# Altium schematic sheet data_logger.SchDoc
size 420 x 297 mm; SheetNumber: 1; SheetTotal: 1; Обозначение_Код: ИУ4 11.03.03.26.06.63.15.003 Э3; п_Разраб_Р: Лучникова И.В.; п_Пров_Р: Чистяков М.Г.; Наименование1: Регистратор данных; Наименование2: на базе ATmega328P-PU; Вид_документа_SCH: Схема электрическая принципиальная
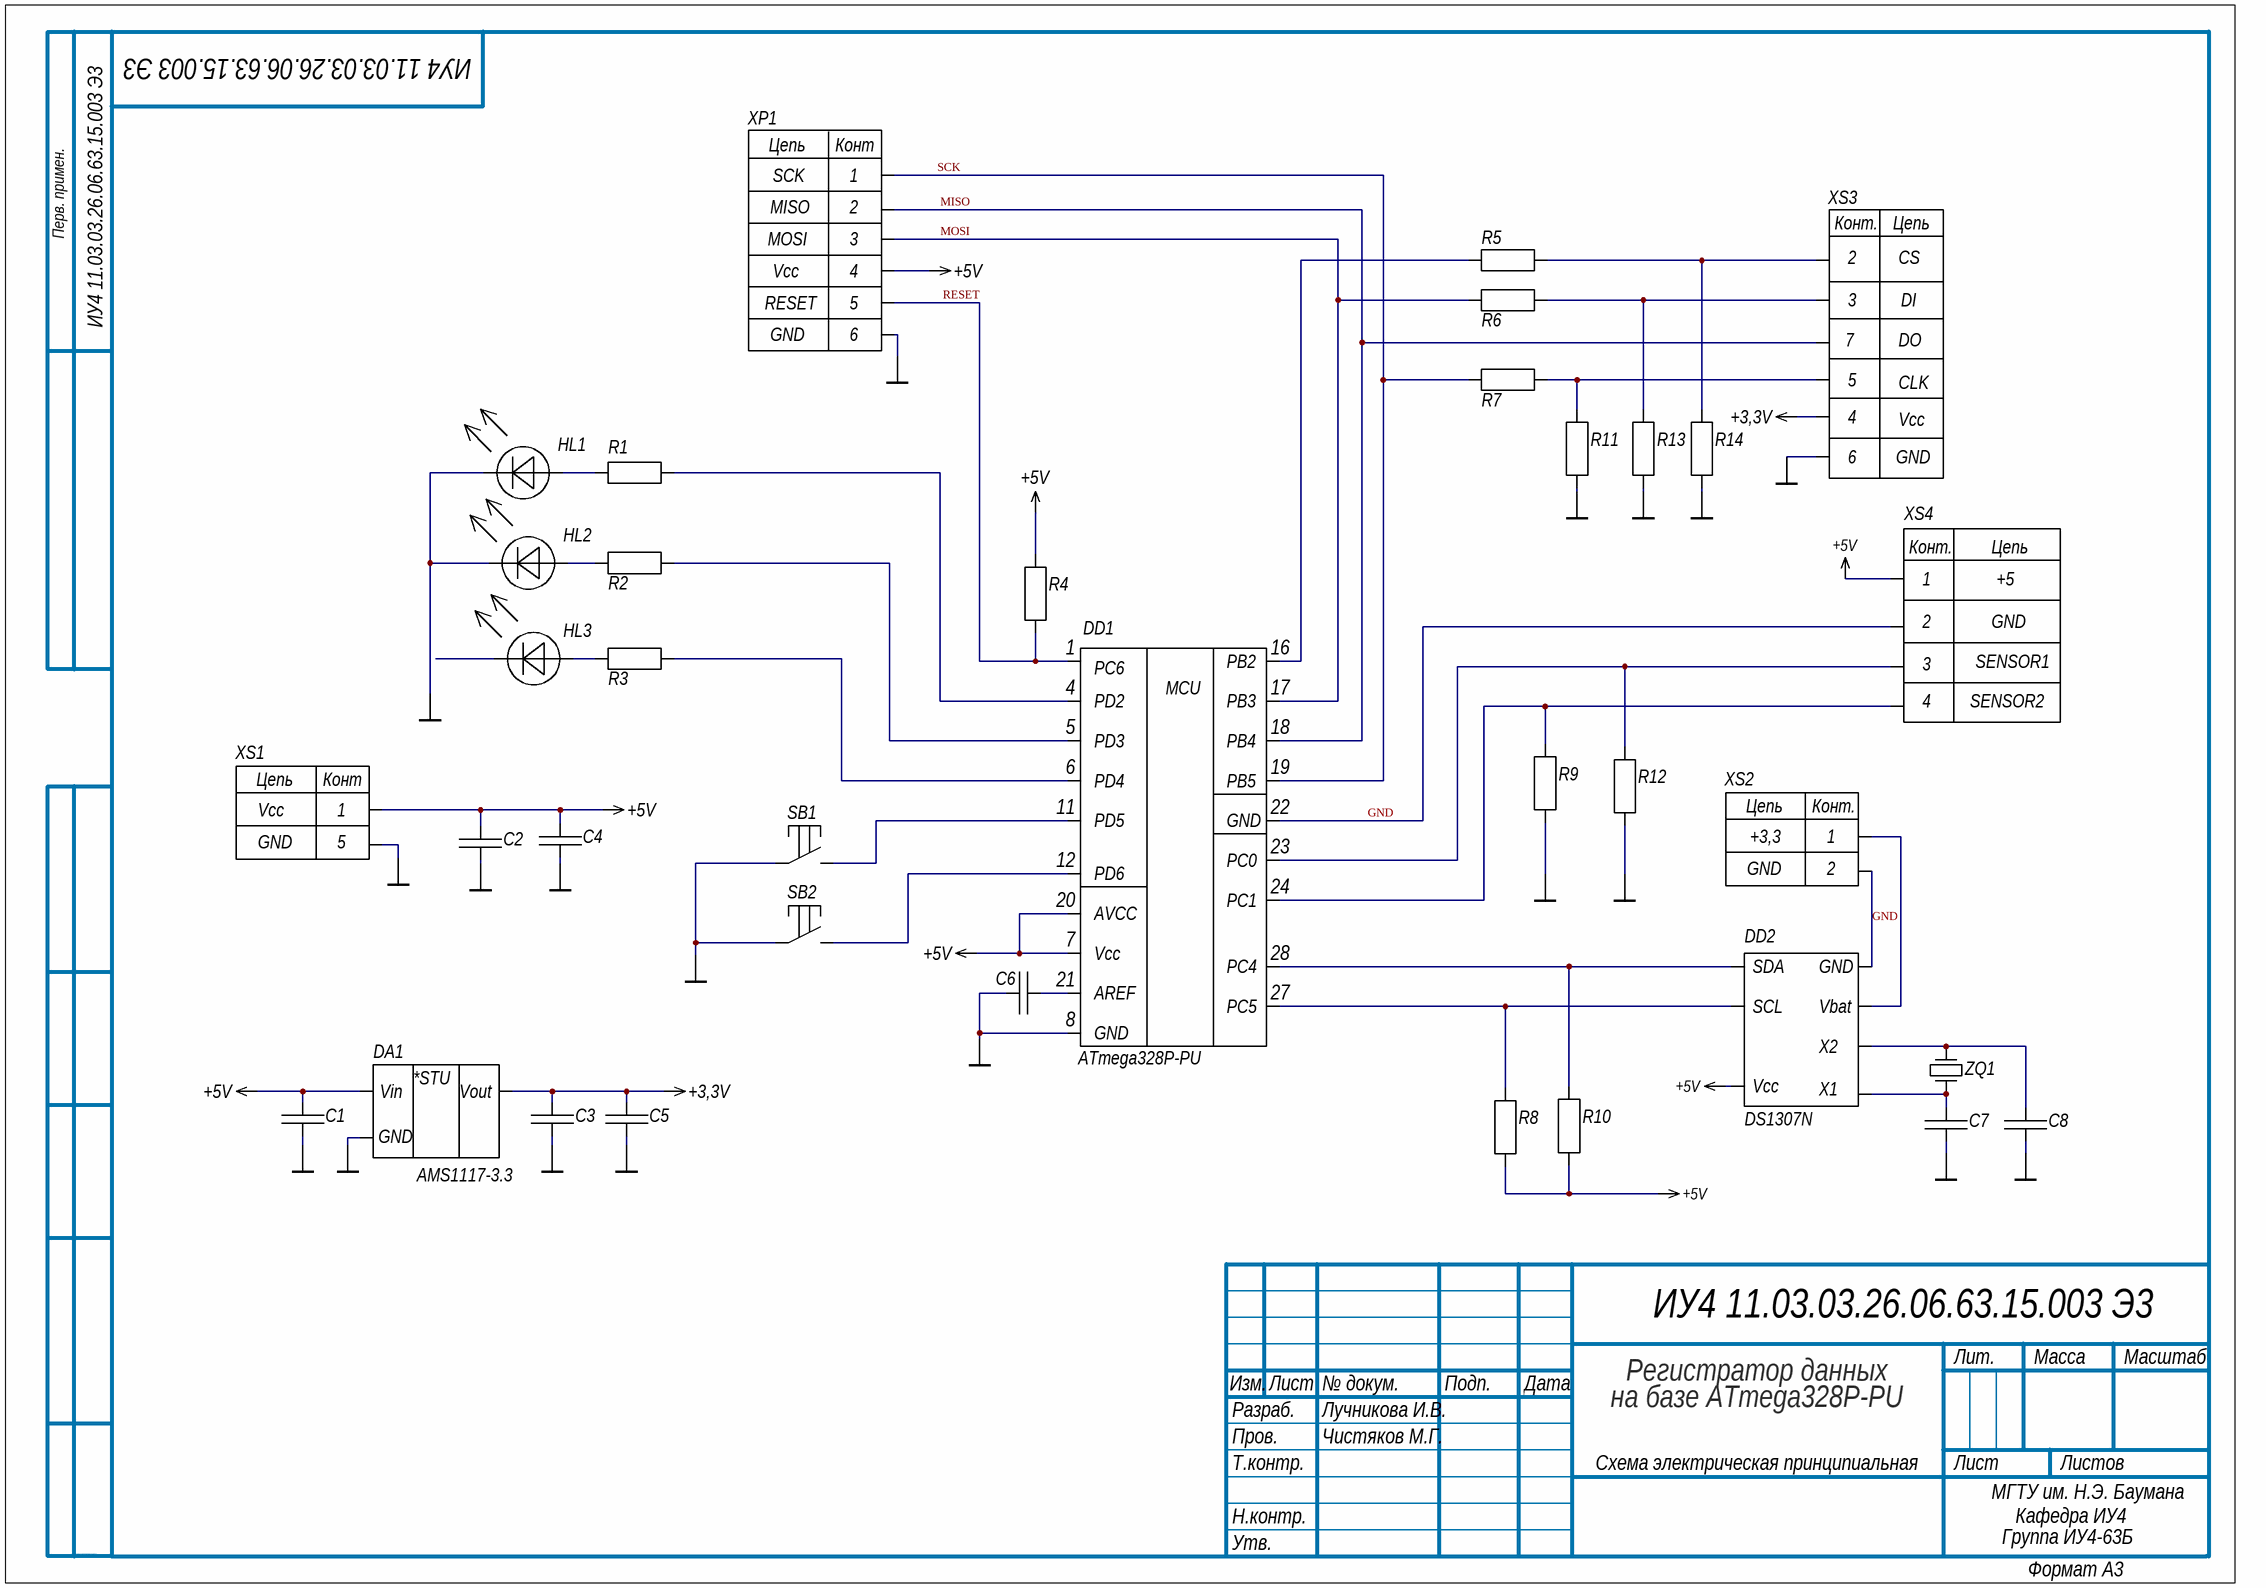
[diagram p0: data_logger.SchDoc]

## Parts
C1  cap  [SMDcap]  (value not drawn)
C2  cap  [SMDcap]  (value not drawn)
C3  cap  [SMDcap]  (value not drawn)
C4  cap  [SMDcap]  (value not drawn)
C5  cap  [SMDcap]  (value not drawn)
C6  cap  [SMDcap]  (value not drawn)
C7  cap  [SMDcap]  (value not drawn)
C8  cap  [SMDcap]  (value not drawn)
DA1  AMS1117-3.3  [stab]
DD1  ATmega328P-PU  [ATmega328P-PU]
DD2  DS1307N  [realt]
HL1  HL?  [SMDLED]  (value not drawn)
HL2  HL?  [SMDLED]  (value not drawn)
HL3  HL?  [SMDLED]  (value not drawn)
R1  510 Ом  [SMDRES]  (value not drawn)
R2  (no value)  [SMDRES]
R3  (no value)  [SMDRES]
R4  (no value)  [SMDRES]
R5  (no value)  [SMDRES]
R6  (no value)  [SMDRES]
R7  (no value)  [SMDRES]
R8  (no value)  [SMDRES]
R9  (no value)  [SMDRES]
R10  (no value)  [SMDRES]
R11  (no value)  [SMDRES]
R12  (no value)  [SMDRES]
R13  (no value)  [SMDRES]
R14  (no value)  [SMDRES]
SB1  knopka  [smdknop]  (value not drawn)
SB2  knopka  [smdknop]  (value not drawn)
XP1  prog  [prog]  (value not drawn)
XS1  pit  [pit usb]  (value not drawn)
XS2  batter  [BAT]  (value not drawn)
XS3  SD  [SDcard]  (value not drawn)
XS4  out  [dat]  (value not drawn)
ZQ1  qwartz  [smdqwartz]  (value not drawn)

## Nets
+3,3V: C3.2 C5.2 DA1.2 XS3.4
+5V: C1.2 C2.2 C4.2 DA1.3 DD1.7 DD1.20 DD2.8 R4.2 R8.1 R10.1 XP1.4 XS1.1 XS4.vcc
GND: C1.1 C2.1 C3.1 C4.1 C5.1 C6.2 C7.1 C8.1 DA1.1 DD1.8 DD1.22 DD2.4 HL1.C HL2.C R9.1 R11.1 R12.1 R13.1 R14.1 SB1.1 SB2.1 XP1.6 XS1.5 XS2.N XS3.6 XS4.gnd
MISO: DD1.18 XP1.2 XS3.7
MOSI: DD1.17 R6.2 XP1.3
RESET: DD1.1 R4.1 XP1.5
SCK: DD1.19 R7.1 XP1.1
NetC6_1: C6.1 DD1.21
NetC7_2: C7.2 DD2.1 ZQ1.1
NetC8_2: C8.2 DD2.2 ZQ1.2
NetDD1_4: DD1.4 R1.1
NetDD1_5: DD1.5 R2.1
NetDD1_6: DD1.6 R3.1
NetDD1_11: DD1.11 SB1.2
NetDD1_12: DD1.12 SB2.2
NetDD1_16: DD1.16 R5.2
NetDD1_23: DD1.23 R12.2 XS4.1
NetDD1_24: DD1.24 R9.2 XS4.2
NetDD1_27: DD1.27 DD2.6 R8.2
NetDD1_28: DD1.28 DD2.5 R10.2
NetDD2_3: DD2.3 XS2.P
NetHL1_A: HL1.A R1.2
NetHL2_A: HL2.A R2.2
NetHL3_A: HL3.A R3.2
NetR5_1: R5.1 R14.2 XS3.2
NetR6_1: R6.1 R13.2 XS3.3
NetR7_2: R7.2 R11.2 XS3.5

Not connected (* = marked no-connect by the designer): HL3 C(16)

## Notes on the sheet
- Перв. примен.
- МГТУ им. Н.Э. Баумана
- Кафедра ИУ4
- Группа ИУ4-63Б
- Изм.
- Разраб.
- Лист
- № докум.
- Подп.
- Дата
- Лит.
- Масса
- Масштаб
- Пров.
- Т.контр.
- Листов
- Н.контр.
- Утв.
- ALTIUM GOSTBOM2.0 KEV
- Формат А3
- (in symbol ATmega328P-PU) PB2; PC6; MCU; PD2; PB3; PD3; PB4; PD4; PB5; PD5; GND; PC0; PD6; PC1; AVCC; Vcc; PC4; AREF; PC5
- (in symbol batter) Цепь; Конт.; +3,3; 1; GND; 2
- (in symbol DS3231MZ) SDA; GND; SCL; Vbat; X2; Vcc; X1
- (in symbol out) Конт.; Цепь; +5; GND; SENSOR1; 3; 4; SENSOR2
- (in symbol pit) Цепь; Конт; Vcc; GND
- (in symbol prog) Цепь; Конт; SCK; MISO; MOSI; Vcc; RESET; GND
- (in symbol SD) Конт.; Цепь; CS; DI; DO; CLK; Vcc; GND
- (in symbol stab) *STU; Vin; Vout; GND

## Library data of the parts
DA1 = stab
DD2 = DS3231MZ
R1-R14 = res